# Altium project QuarterBridge_RevK.PrjPcb
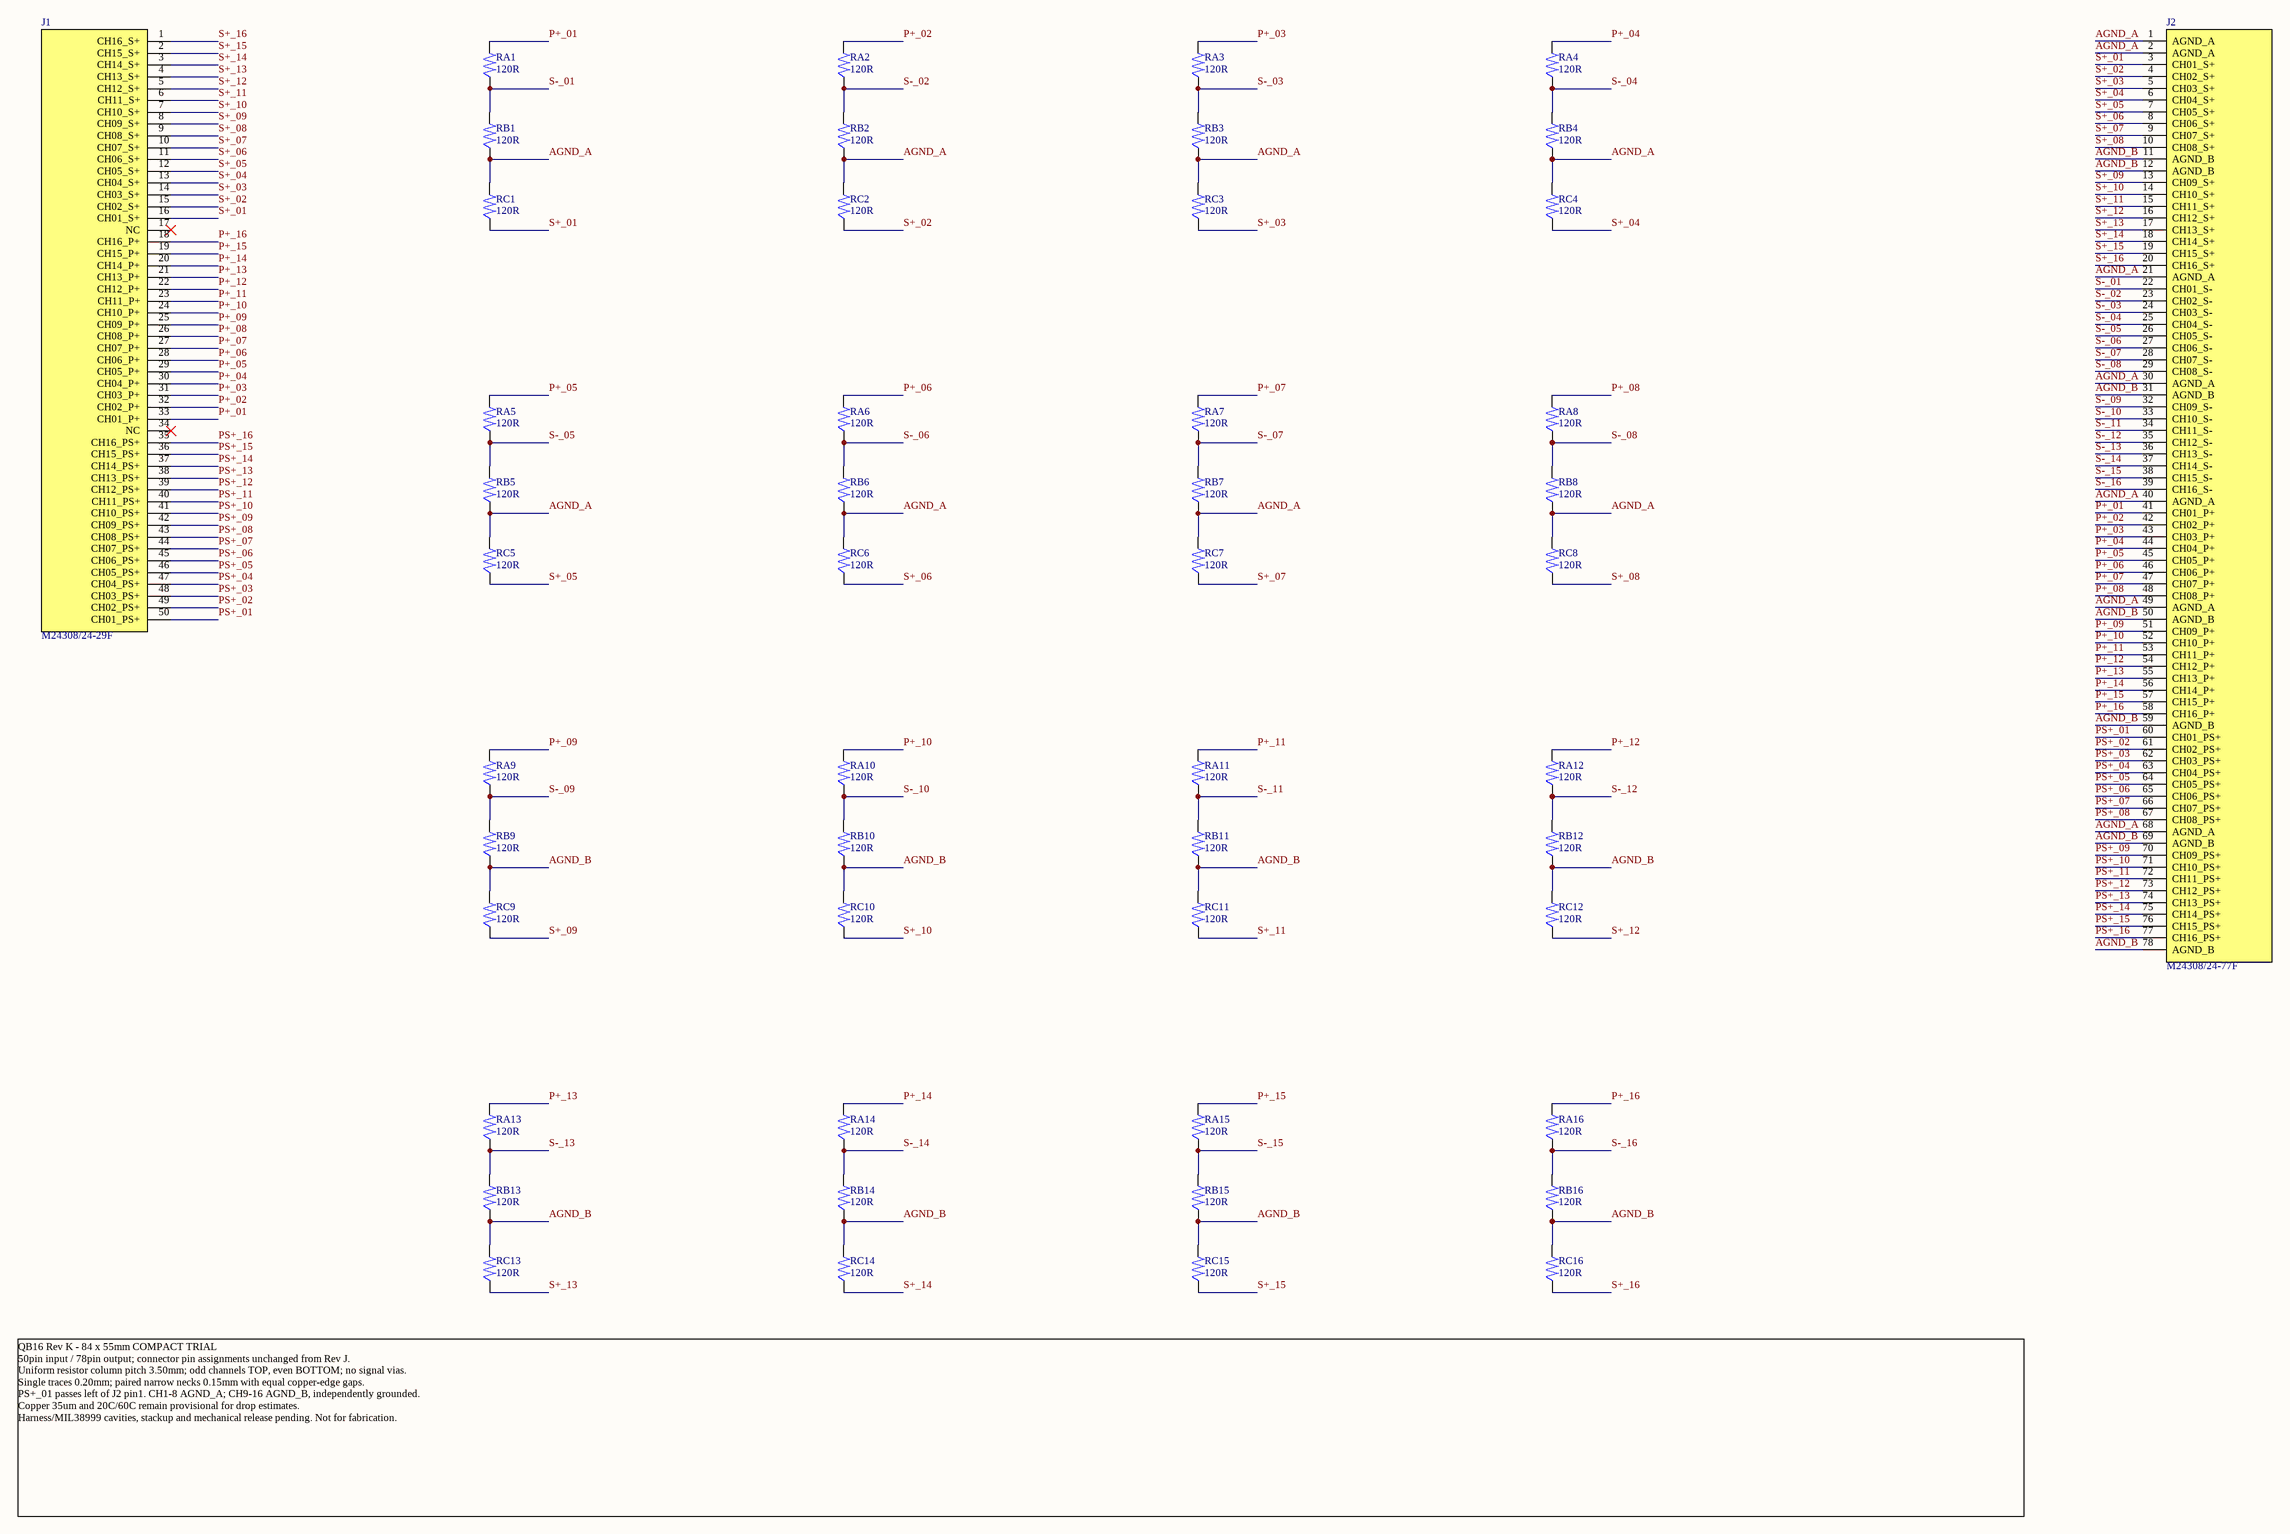
[diagram p0: QuarterBridge_RevK.SchDoc]
1 sheet, 50 parts. Net scope: global (net labels, ports and power ports of the same name join across sheets).
Board file: QuarterBridge_RevK.PcbDoc

## Sheet QuarterBridge_RevK.SchDoc
size A2

### Parts
J1  M24308/24-29F  [QB_ITT_M24308_24_29F_RA_R1]
J2  M24308/24-77F  [QB_POS_M24308_24_77F_RA_R1]
RA1  120R  [QB_TNPU1206_IPC_R1]
RA2  120R  [QB_TNPU1206_IPC_R1]
RA3  120R  [QB_TNPU1206_IPC_R1]
RA4  120R  [QB_TNPU1206_IPC_R1]
RA5  120R  [QB_TNPU1206_IPC_R1]
RA6  120R  [QB_TNPU1206_IPC_R1]
RA7  120R  [QB_TNPU1206_IPC_R1]
RA8  120R  [QB_TNPU1206_IPC_R1]
RA9  120R  [QB_TNPU1206_IPC_R1]
RA10  120R  [QB_TNPU1206_IPC_R1]
RA11  120R  [QB_TNPU1206_IPC_R1]
RA12  120R  [QB_TNPU1206_IPC_R1]
RA13  120R  [QB_TNPU1206_IPC_R1]
RA14  120R  [QB_TNPU1206_IPC_R1]
RA15  120R  [QB_TNPU1206_IPC_R1]
RA16  120R  [QB_TNPU1206_IPC_R1]
RB1  120R  [QB_TNPU1206_IPC_R1]
RB2  120R  [QB_TNPU1206_IPC_R1]
RB3  120R  [QB_TNPU1206_IPC_R1]
RB4  120R  [QB_TNPU1206_IPC_R1]
RB5  120R  [QB_TNPU1206_IPC_R1]
RB6  120R  [QB_TNPU1206_IPC_R1]
RB7  120R  [QB_TNPU1206_IPC_R1]
RB8  120R  [QB_TNPU1206_IPC_R1]
RB9  120R  [QB_TNPU1206_IPC_R1]
RB10  120R  [QB_TNPU1206_IPC_R1]
RB11  120R  [QB_TNPU1206_IPC_R1]
RB12  120R  [QB_TNPU1206_IPC_R1]
RB13  120R  [QB_TNPU1206_IPC_R1]
RB14  120R  [QB_TNPU1206_IPC_R1]
RB15  120R  [QB_TNPU1206_IPC_R1]
RB16  120R  [QB_TNPU1206_IPC_R1]
RC1  120R  [QB_TNPU1206_IPC_R1]
RC2  120R  [QB_TNPU1206_IPC_R1]
RC3  120R  [QB_TNPU1206_IPC_R1]
RC4  120R  [QB_TNPU1206_IPC_R1]
RC5  120R  [QB_TNPU1206_IPC_R1]
RC6  120R  [QB_TNPU1206_IPC_R1]
RC7  120R  [QB_TNPU1206_IPC_R1]
RC8  120R  [QB_TNPU1206_IPC_R1]
RC9  120R  [QB_TNPU1206_IPC_R1]
RC10  120R  [QB_TNPU1206_IPC_R1]
RC11  120R  [QB_TNPU1206_IPC_R1]
RC12  120R  [QB_TNPU1206_IPC_R1]
RC13  120R  [QB_TNPU1206_IPC_R1]
RC14  120R  [QB_TNPU1206_IPC_R1]
RC15  120R  [QB_TNPU1206_IPC_R1]
RC16  120R  [QB_TNPU1206_IPC_R1]

### Nets
AGND_A: J2.1(AGND_A) J2.2(AGND_A) J2.21(AGND_A) J2.30(AGND_A) J2.40(AGND_A) J2.49(AGND_A) J2.68(AGND_A) RB1.2 RB2.2 RB3.2 RB4.2 RB5.2 RB6.2 RB7.2 RB8.2 RC1.1 RC2.1 RC3.1 RC4.1 RC5.1 RC6.1 RC7.1 RC8.1
AGND_B: J2.11(AGND_B) J2.12(AGND_B) J2.31(AGND_B) J2.50(AGND_B) J2.59(AGND_B) J2.69(AGND_B) J2.78(AGND_B) RB9.2 RB10.2 RB11.2 RB12.2 RB13.2 RB14.2 RB15.2 RB16.2 RC9.1 RC10.1 RC11.1 RC12.1 RC13.1 RC14.1 RC15.1 RC16.1
P+_01: J1.33(CH01_P+) J2.41(CH01_P+) RA1.1
P+_02: J1.32(CH02_P+) J2.42(CH02_P+) RA2.1
P+_03: J1.31(CH03_P+) J2.43(CH03_P+) RA3.1
P+_04: J1.30(CH04_P+) J2.44(CH04_P+) RA4.1
P+_05: J1.29(CH05_P+) J2.45(CH05_P+) RA5.1
P+_06: J1.28(CH06_P+) J2.46(CH06_P+) RA6.1
P+_07: J1.27(CH07_P+) J2.47(CH07_P+) RA7.1
P+_08: J1.26(CH08_P+) J2.48(CH08_P+) RA8.1
P+_09: J1.25(CH09_P+) J2.51(CH09_P+) RA9.1
P+_10: J1.24(CH10_P+) J2.52(CH10_P+) RA10.1
P+_11: J1.23(CH11_P+) J2.53(CH11_P+) RA11.1
P+_12: J1.22(CH12_P+) J2.54(CH12_P+) RA12.1
P+_13: J1.21(CH13_P+) J2.55(CH13_P+) RA13.1
P+_14: J1.20(CH14_P+) J2.56(CH14_P+) RA14.1
P+_15: J1.19(CH15_P+) J2.57(CH15_P+) RA15.1
P+_16: J1.18(CH16_P+) J2.58(CH16_P+) RA16.1
PS+_01: J1.50(CH01_PS+) J2.60(CH01_PS+)
PS+_02: J1.49(CH02_PS+) J2.61(CH02_PS+)
PS+_03: J1.48(CH03_PS+) J2.62(CH03_PS+)
PS+_04: J1.47(CH04_PS+) J2.63(CH04_PS+)
PS+_05: J1.46(CH05_PS+) J2.64(CH05_PS+)
PS+_06: J1.45(CH06_PS+) J2.65(CH06_PS+)
PS+_07: J1.44(CH07_PS+) J2.66(CH07_PS+)
PS+_08: J1.43(CH08_PS+) J2.67(CH08_PS+)
PS+_09: J1.42(CH09_PS+) J2.70(CH09_PS+)
PS+_10: J1.41(CH10_PS+) J2.71(CH10_PS+)
PS+_11: J1.40(CH11_PS+) J2.72(CH11_PS+)
PS+_12: J1.39(CH12_PS+) J2.73(CH12_PS+)
PS+_13: J1.38(CH13_PS+) J2.74(CH13_PS+)
PS+_14: J1.37(CH14_PS+) J2.75(CH14_PS+)
PS+_15: J1.36(CH15_PS+) J2.76(CH15_PS+)
PS+_16: J1.35(CH16_PS+) J2.77(CH16_PS+)
S+_01: J1.16(CH01_S+) J2.3(CH01_S+) RC1.2
S+_02: J1.15(CH02_S+) J2.4(CH02_S+) RC2.2
S+_03: J1.14(CH03_S+) J2.5(CH03_S+) RC3.2
S+_04: J1.13(CH04_S+) J2.6(CH04_S+) RC4.2
S+_05: J1.12(CH05_S+) J2.7(CH05_S+) RC5.2
S+_06: J1.11(CH06_S+) J2.8(CH06_S+) RC6.2
S+_07: J1.10(CH07_S+) J2.9(CH07_S+) RC7.2
S+_08: J1.9(CH08_S+) J2.10(CH08_S+) RC8.2
S+_09: J1.8(CH09_S+) J2.13(CH09_S+) RC9.2
S+_10: J1.7(CH10_S+) J2.14(CH10_S+) RC10.2
S+_11: J1.6(CH11_S+) J2.15(CH11_S+) RC11.2
S+_12: J1.5(CH12_S+) J2.16(CH12_S+) RC12.2
S+_13: J1.4(CH13_S+) J2.17(CH13_S+) RC13.2
S+_14: J1.3(CH14_S+) J2.18(CH14_S+) RC14.2
S+_15: J1.2(CH15_S+) J2.19(CH15_S+) RC15.2
S+_16: J1.1(CH16_S+) J2.20(CH16_S+) RC16.2
S-_01: J2.22(CH01_S-) RA1.2 RB1.1
S-_02: J2.23(CH02_S-) RA2.2 RB2.1
S-_03: J2.24(CH03_S-) RA3.2 RB3.1
S-_04: J2.25(CH04_S-) RA4.2 RB4.1
S-_05: J2.26(CH05_S-) RA5.2 RB5.1
S-_06: J2.27(CH06_S-) RA6.2 RB6.1
S-_07: J2.28(CH07_S-) RA7.2 RB7.1
S-_08: J2.29(CH08_S-) RA8.2 RB8.1
S-_09: J2.32(CH09_S-) RA9.2 RB9.1
S-_10: J2.33(CH10_S-) RA10.2 RB10.1
S-_11: J2.34(CH11_S-) RA11.2 RB11.1
S-_12: J2.35(CH12_S-) RA12.2 RB12.1
S-_13: J2.36(CH13_S-) RA13.2 RB13.1
S-_14: J2.37(CH14_S-) RA14.2 RB14.1
S-_15: J2.38(CH15_S-) RA15.2 RB15.1
S-_16: J2.39(CH16_S-) RA16.2 RB16.1

Not connected (* = marked no-connect by the designer): J1 17(NC)* 34(NC)*

### Notes on the sheet
- QB16 Rev K - 84 x 55mm COMPACT TRIAL
  50pin input / 78pin output; connector pin assignments unchanged from Rev J.
  Uniform resistor column pitch 3.50mm; odd channels TOP, even BOTTOM; no signal vias.
  Single traces 0.20mm; paired narrow necks 0.15mm with equal copper-edge gaps.
  PS+_01 passes left of J2 pin1. CH1-8 AGND_A; CH9-16 AGND_B, independently grounded.
  Copper 35um and 20C/60C remain provisional for drop estimates.
  Harness/MIL38999 cavities, stackup and mechanical release pending. Not for fabrication.

### Library data of the parts
J1 = MIL_DSUB50_PIN_RA_24_29F: MIL-DTL-24308 right angle male; provisional spatial pinout, physical footprint not yet assigned
J2 = MIL_DSUB78_PIN_RA_24_77F: MIL-DTL-24308 right angle male; provisional spatial pinout, physical footprint not yet assigned
RA1 = TNPU1206120RAZEN00_ANSI: 120 ohm 0.05% 5ppm/K 1206; ANSI zigzag; Manufacturer: Vishay; Channel: CH01; BridgeRole: RA; PCB_Side: Top; DAQ_Card: A; MPN: TNPU1206120RAZEN00; Tolerance: 0.05%; TCR: 5 ppm/K; Package: 1206
RA2 = TNPU1206120RAZEN00_ANSI: 120 ohm 0.05% 5ppm/K 1206; ANSI zigzag; Manufacturer: Vishay; Channel: CH02; BridgeRole: RA; PCB_Side: Bottom; DAQ_Card: A; MPN: TNPU1206120RAZEN00; Tolerance: 0.05%; TCR: 5 ppm/K; Package: 1206
RA3 = TNPU1206120RAZEN00_ANSI: 120 ohm 0.05% 5ppm/K 1206; ANSI zigzag; Manufacturer: Vishay; Channel: CH03; BridgeRole: RA; PCB_Side: Top; DAQ_Card: A; MPN: TNPU1206120RAZEN00; Tolerance: 0.05%; TCR: 5 ppm/K; Package: 1206
RA4 = TNPU1206120RAZEN00_ANSI: 120 ohm 0.05% 5ppm/K 1206; ANSI zigzag; Manufacturer: Vishay; Channel: CH04; BridgeRole: RA; PCB_Side: Bottom; DAQ_Card: A; MPN: TNPU1206120RAZEN00; Tolerance: 0.05%; TCR: 5 ppm/K; Package: 1206
RA5 = TNPU1206120RAZEN00_ANSI: 120 ohm 0.05% 5ppm/K 1206; ANSI zigzag; Manufacturer: Vishay; Channel: CH05; BridgeRole: RA; PCB_Side: Top; DAQ_Card: A; MPN: TNPU1206120RAZEN00; Tolerance: 0.05%; TCR: 5 ppm/K; Package: 1206
RA6 = TNPU1206120RAZEN00_ANSI: 120 ohm 0.05% 5ppm/K 1206; ANSI zigzag; Manufacturer: Vishay; Channel: CH06; BridgeRole: RA; PCB_Side: Bottom; DAQ_Card: A; MPN: TNPU1206120RAZEN00; Tolerance: 0.05%; TCR: 5 ppm/K; Package: 1206
RA7 = TNPU1206120RAZEN00_ANSI: 120 ohm 0.05% 5ppm/K 1206; ANSI zigzag; Manufacturer: Vishay; Channel: CH07; BridgeRole: RA; PCB_Side: Top; DAQ_Card: A; MPN: TNPU1206120RAZEN00; Tolerance: 0.05%; TCR: 5 ppm/K; Package: 1206
RA8 = TNPU1206120RAZEN00_ANSI: 120 ohm 0.05% 5ppm/K 1206; ANSI zigzag; Manufacturer: Vishay; Channel: CH08; BridgeRole: RA; PCB_Side: Bottom; DAQ_Card: A; MPN: TNPU1206120RAZEN00; Tolerance: 0.05%; TCR: 5 ppm/K; Package: 1206
RA9 = TNPU1206120RAZEN00_ANSI: 120 ohm 0.05% 5ppm/K 1206; ANSI zigzag; Manufacturer: Vishay; Channel: CH09; BridgeRole: RA; PCB_Side: Top; DAQ_Card: B; MPN: TNPU1206120RAZEN00; Tolerance: 0.05%; TCR: 5 ppm/K; Package: 1206
RA10 = TNPU1206120RAZEN00_ANSI: 120 ohm 0.05% 5ppm/K 1206; ANSI zigzag; Manufacturer: Vishay; Channel: CH10; BridgeRole: RA; PCB_Side: Bottom; DAQ_Card: B; MPN: TNPU1206120RAZEN00; Tolerance: 0.05%; TCR: 5 ppm/K; Package: 1206
RA11 = TNPU1206120RAZEN00_ANSI: 120 ohm 0.05% 5ppm/K 1206; ANSI zigzag; Manufacturer: Vishay; Channel: CH11; BridgeRole: RA; PCB_Side: Top; DAQ_Card: B; MPN: TNPU1206120RAZEN00; Tolerance: 0.05%; TCR: 5 ppm/K; Package: 1206
RA12 = TNPU1206120RAZEN00_ANSI: 120 ohm 0.05% 5ppm/K 1206; ANSI zigzag; Manufacturer: Vishay; Channel: CH12; BridgeRole: RA; PCB_Side: Bottom; DAQ_Card: B; MPN: TNPU1206120RAZEN00; Tolerance: 0.05%; TCR: 5 ppm/K; Package: 1206
RA13 = TNPU1206120RAZEN00_ANSI: 120 ohm 0.05% 5ppm/K 1206; ANSI zigzag; Manufacturer: Vishay; Channel: CH13; BridgeRole: RA; PCB_Side: Top; DAQ_Card: B; MPN: TNPU1206120RAZEN00; Tolerance: 0.05%; TCR: 5 ppm/K; Package: 1206
RA14 = TNPU1206120RAZEN00_ANSI: 120 ohm 0.05% 5ppm/K 1206; ANSI zigzag; Manufacturer: Vishay; Channel: CH14; BridgeRole: RA; PCB_Side: Bottom; DAQ_Card: B; MPN: TNPU1206120RAZEN00; Tolerance: 0.05%; TCR: 5 ppm/K; Package: 1206
RA15 = TNPU1206120RAZEN00_ANSI: 120 ohm 0.05% 5ppm/K 1206; ANSI zigzag; Manufacturer: Vishay; Channel: CH15; BridgeRole: RA; PCB_Side: Top; DAQ_Card: B; MPN: TNPU1206120RAZEN00; Tolerance: 0.05%; TCR: 5 ppm/K; Package: 1206
RA16 = TNPU1206120RAZEN00_ANSI: 120 ohm 0.05% 5ppm/K 1206; ANSI zigzag; Manufacturer: Vishay; Channel: CH16; BridgeRole: RA; PCB_Side: Bottom; DAQ_Card: B; MPN: TNPU1206120RAZEN00; Tolerance: 0.05%; TCR: 5 ppm/K; Package: 1206
RB1 = TNPU1206120RAZEN00_ANSI: 120 ohm 0.05% 5ppm/K 1206; ANSI zigzag; Manufacturer: Vishay; Channel: CH01; BridgeRole: RB; PCB_Side: Top; DAQ_Card: A; MPN: TNPU1206120RAZEN00; Tolerance: 0.05%; TCR: 5 ppm/K; Package: 1206
RB2 = TNPU1206120RAZEN00_ANSI: 120 ohm 0.05% 5ppm/K 1206; ANSI zigzag; Manufacturer: Vishay; Channel: CH02; BridgeRole: RB; PCB_Side: Bottom; DAQ_Card: A; MPN: TNPU1206120RAZEN00; Tolerance: 0.05%; TCR: 5 ppm/K; Package: 1206
RB3 = TNPU1206120RAZEN00_ANSI: 120 ohm 0.05% 5ppm/K 1206; ANSI zigzag; Manufacturer: Vishay; Channel: CH03; BridgeRole: RB; PCB_Side: Top; DAQ_Card: A; MPN: TNPU1206120RAZEN00; Tolerance: 0.05%; TCR: 5 ppm/K; Package: 1206
RB4 = TNPU1206120RAZEN00_ANSI: 120 ohm 0.05% 5ppm/K 1206; ANSI zigzag; Manufacturer: Vishay; Channel: CH04; BridgeRole: RB; PCB_Side: Bottom; DAQ_Card: A; MPN: TNPU1206120RAZEN00; Tolerance: 0.05%; TCR: 5 ppm/K; Package: 1206
RB5 = TNPU1206120RAZEN00_ANSI: 120 ohm 0.05% 5ppm/K 1206; ANSI zigzag; Manufacturer: Vishay; Channel: CH05; BridgeRole: RB; PCB_Side: Top; DAQ_Card: A; MPN: TNPU1206120RAZEN00; Tolerance: 0.05%; TCR: 5 ppm/K; Package: 1206
RB6 = TNPU1206120RAZEN00_ANSI: 120 ohm 0.05% 5ppm/K 1206; ANSI zigzag; Manufacturer: Vishay; Channel: CH06; BridgeRole: RB; PCB_Side: Bottom; DAQ_Card: A; MPN: TNPU1206120RAZEN00; Tolerance: 0.05%; TCR: 5 ppm/K; Package: 1206
RB7 = TNPU1206120RAZEN00_ANSI: 120 ohm 0.05% 5ppm/K 1206; ANSI zigzag; Manufacturer: Vishay; Channel: CH07; BridgeRole: RB; PCB_Side: Top; DAQ_Card: A; MPN: TNPU1206120RAZEN00; Tolerance: 0.05%; TCR: 5 ppm/K; Package: 1206
RB8 = TNPU1206120RAZEN00_ANSI: 120 ohm 0.05% 5ppm/K 1206; ANSI zigzag; Manufacturer: Vishay; Channel: CH08; BridgeRole: RB; PCB_Side: Bottom; DAQ_Card: A; MPN: TNPU1206120RAZEN00; Tolerance: 0.05%; TCR: 5 ppm/K; Package: 1206
RB9 = TNPU1206120RAZEN00_ANSI: 120 ohm 0.05% 5ppm/K 1206; ANSI zigzag; Manufacturer: Vishay; Channel: CH09; BridgeRole: RB; PCB_Side: Top; DAQ_Card: B; MPN: TNPU1206120RAZEN00; Tolerance: 0.05%; TCR: 5 ppm/K; Package: 1206
RB10 = TNPU1206120RAZEN00_ANSI: 120 ohm 0.05% 5ppm/K 1206; ANSI zigzag; Manufacturer: Vishay; Channel: CH10; BridgeRole: RB; PCB_Side: Bottom; DAQ_Card: B; MPN: TNPU1206120RAZEN00; Tolerance: 0.05%; TCR: 5 ppm/K; Package: 1206
RB11 = TNPU1206120RAZEN00_ANSI: 120 ohm 0.05% 5ppm/K 1206; ANSI zigzag; Manufacturer: Vishay; Channel: CH11; BridgeRole: RB; PCB_Side: Top; DAQ_Card: B; MPN: TNPU1206120RAZEN00; Tolerance: 0.05%; TCR: 5 ppm/K; Package: 1206
RB12 = TNPU1206120RAZEN00_ANSI: 120 ohm 0.05% 5ppm/K 1206; ANSI zigzag; Manufacturer: Vishay; Channel: CH12; BridgeRole: RB; PCB_Side: Bottom; DAQ_Card: B; MPN: TNPU1206120RAZEN00; Tolerance: 0.05%; TCR: 5 ppm/K; Package: 1206
RB13 = TNPU1206120RAZEN00_ANSI: 120 ohm 0.05% 5ppm/K 1206; ANSI zigzag; Manufacturer: Vishay; Channel: CH13; BridgeRole: RB; PCB_Side: Top; DAQ_Card: B; MPN: TNPU1206120RAZEN00; Tolerance: 0.05%; TCR: 5 ppm/K; Package: 1206
RB14 = TNPU1206120RAZEN00_ANSI: 120 ohm 0.05% 5ppm/K 1206; ANSI zigzag; Manufacturer: Vishay; Channel: CH14; BridgeRole: RB; PCB_Side: Bottom; DAQ_Card: B; MPN: TNPU1206120RAZEN00; Tolerance: 0.05%; TCR: 5 ppm/K; Package: 1206
RB15 = TNPU1206120RAZEN00_ANSI: 120 ohm 0.05% 5ppm/K 1206; ANSI zigzag; Manufacturer: Vishay; Channel: CH15; BridgeRole: RB; PCB_Side: Top; DAQ_Card: B; MPN: TNPU1206120RAZEN00; Tolerance: 0.05%; TCR: 5 ppm/K; Package: 1206
RB16 = TNPU1206120RAZEN00_ANSI: 120 ohm 0.05% 5ppm/K 1206; ANSI zigzag; Manufacturer: Vishay; Channel: CH16; BridgeRole: RB; PCB_Side: Bottom; DAQ_Card: B; MPN: TNPU1206120RAZEN00; Tolerance: 0.05%; TCR: 5 ppm/K; Package: 1206
RC1 = TNPU1206120RAZEN00_ANSI: 120 ohm 0.05% 5ppm/K 1206; ANSI zigzag; Manufacturer: Vishay; Channel: CH01; BridgeRole: RC; PCB_Side: Top; DAQ_Card: A; MPN: TNPU1206120RAZEN00; Tolerance: 0.05%; TCR: 5 ppm/K; Package: 1206
RC2 = TNPU1206120RAZEN00_ANSI: 120 ohm 0.05% 5ppm/K 1206; ANSI zigzag; Manufacturer: Vishay; Channel: CH02; BridgeRole: RC; PCB_Side: Bottom; DAQ_Card: A; MPN: TNPU1206120RAZEN00; Tolerance: 0.05%; TCR: 5 ppm/K; Package: 1206
RC3 = TNPU1206120RAZEN00_ANSI: 120 ohm 0.05% 5ppm/K 1206; ANSI zigzag; Manufacturer: Vishay; Channel: CH03; BridgeRole: RC; PCB_Side: Top; DAQ_Card: A; MPN: TNPU1206120RAZEN00; Tolerance: 0.05%; TCR: 5 ppm/K; Package: 1206
RC4 = TNPU1206120RAZEN00_ANSI: 120 ohm 0.05% 5ppm/K 1206; ANSI zigzag; Manufacturer: Vishay; Channel: CH04; BridgeRole: RC; PCB_Side: Bottom; DAQ_Card: A; MPN: TNPU1206120RAZEN00; Tolerance: 0.05%; TCR: 5 ppm/K; Package: 1206
RC5 = TNPU1206120RAZEN00_ANSI: 120 ohm 0.05% 5ppm/K 1206; ANSI zigzag; Manufacturer: Vishay; Channel: CH05; BridgeRole: RC; PCB_Side: Top; DAQ_Card: A; MPN: TNPU1206120RAZEN00; Tolerance: 0.05%; TCR: 5 ppm/K; Package: 1206
RC6 = TNPU1206120RAZEN00_ANSI: 120 ohm 0.05% 5ppm/K 1206; ANSI zigzag; Manufacturer: Vishay; Channel: CH06; BridgeRole: RC; PCB_Side: Bottom; DAQ_Card: A; MPN: TNPU1206120RAZEN00; Tolerance: 0.05%; TCR: 5 ppm/K; Package: 1206
RC7 = TNPU1206120RAZEN00_ANSI: 120 ohm 0.05% 5ppm/K 1206; ANSI zigzag; Manufacturer: Vishay; Channel: CH07; BridgeRole: RC; PCB_Side: Top; DAQ_Card: A; MPN: TNPU1206120RAZEN00; Tolerance: 0.05%; TCR: 5 ppm/K; Package: 1206
RC8 = TNPU1206120RAZEN00_ANSI: 120 ohm 0.05% 5ppm/K 1206; ANSI zigzag; Manufacturer: Vishay; Channel: CH08; BridgeRole: RC; PCB_Side: Bottom; DAQ_Card: A; MPN: TNPU1206120RAZEN00; Tolerance: 0.05%; TCR: 5 ppm/K; Package: 1206
RC9 = TNPU1206120RAZEN00_ANSI: 120 ohm 0.05% 5ppm/K 1206; ANSI zigzag; Manufacturer: Vishay; Channel: CH09; BridgeRole: RC; PCB_Side: Top; DAQ_Card: B; MPN: TNPU1206120RAZEN00; Tolerance: 0.05%; TCR: 5 ppm/K; Package: 1206
RC10 = TNPU1206120RAZEN00_ANSI: 120 ohm 0.05% 5ppm/K 1206; ANSI zigzag; Manufacturer: Vishay; Channel: CH10; BridgeRole: RC; PCB_Side: Bottom; DAQ_Card: B; MPN: TNPU1206120RAZEN00; Tolerance: 0.05%; TCR: 5 ppm/K; Package: 1206
RC11 = TNPU1206120RAZEN00_ANSI: 120 ohm 0.05% 5ppm/K 1206; ANSI zigzag; Manufacturer: Vishay; Channel: CH11; BridgeRole: RC; PCB_Side: Top; DAQ_Card: B; MPN: TNPU1206120RAZEN00; Tolerance: 0.05%; TCR: 5 ppm/K; Package: 1206
RC12 = TNPU1206120RAZEN00_ANSI: 120 ohm 0.05% 5ppm/K 1206; ANSI zigzag; Manufacturer: Vishay; Channel: CH12; BridgeRole: RC; PCB_Side: Bottom; DAQ_Card: B; MPN: TNPU1206120RAZEN00; Tolerance: 0.05%; TCR: 5 ppm/K; Package: 1206
RC13 = TNPU1206120RAZEN00_ANSI: 120 ohm 0.05% 5ppm/K 1206; ANSI zigzag; Manufacturer: Vishay; Channel: CH13; BridgeRole: RC; PCB_Side: Top; DAQ_Card: B; MPN: TNPU1206120RAZEN00; Tolerance: 0.05%; TCR: 5 ppm/K; Package: 1206
RC14 = TNPU1206120RAZEN00_ANSI: 120 ohm 0.05% 5ppm/K 1206; ANSI zigzag; Manufacturer: Vishay; Channel: CH14; BridgeRole: RC; PCB_Side: Bottom; DAQ_Card: B; MPN: TNPU1206120RAZEN00; Tolerance: 0.05%; TCR: 5 ppm/K; Package: 1206
RC15 = TNPU1206120RAZEN00_ANSI: 120 ohm 0.05% 5ppm/K 1206; ANSI zigzag; Manufacturer: Vishay; Channel: CH15; BridgeRole: RC; PCB_Side: Top; DAQ_Card: B; MPN: TNPU1206120RAZEN00; Tolerance: 0.05%; TCR: 5 ppm/K; Package: 1206
RC16 = TNPU1206120RAZEN00_ANSI: 120 ohm 0.05% 5ppm/K 1206; ANSI zigzag; Manufacturer: Vishay; Channel: CH16; BridgeRole: RC; PCB_Side: Bottom; DAQ_Card: B; MPN: TNPU1206120RAZEN00; Tolerance: 0.05%; TCR: 5 ppm/K; Package: 1206